# Altium schematic sheet Top_Sheet.SchDoc
size A4; DocumentNumber: 1; SheetNumber: 1; SheetTotal: 2
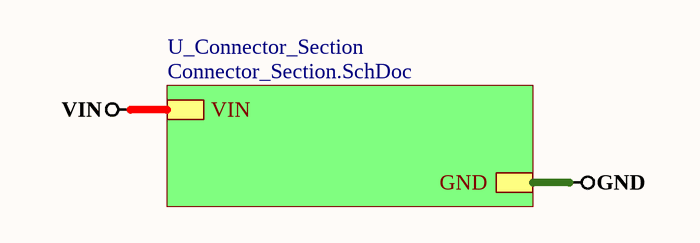
[diagram p0: Top_Sheet.SchDoc]

## Sub-sheets
U_Connector_Section = Connector_Section.SchDoc: VIN, GND

## Nets
GND: sheet U_Connector_Section/GND
VIN: sheet U_Connector_Section/VIN